# EAGLE design Trash_Bin_Board_V1.0 (EAGLE 7.7.0)
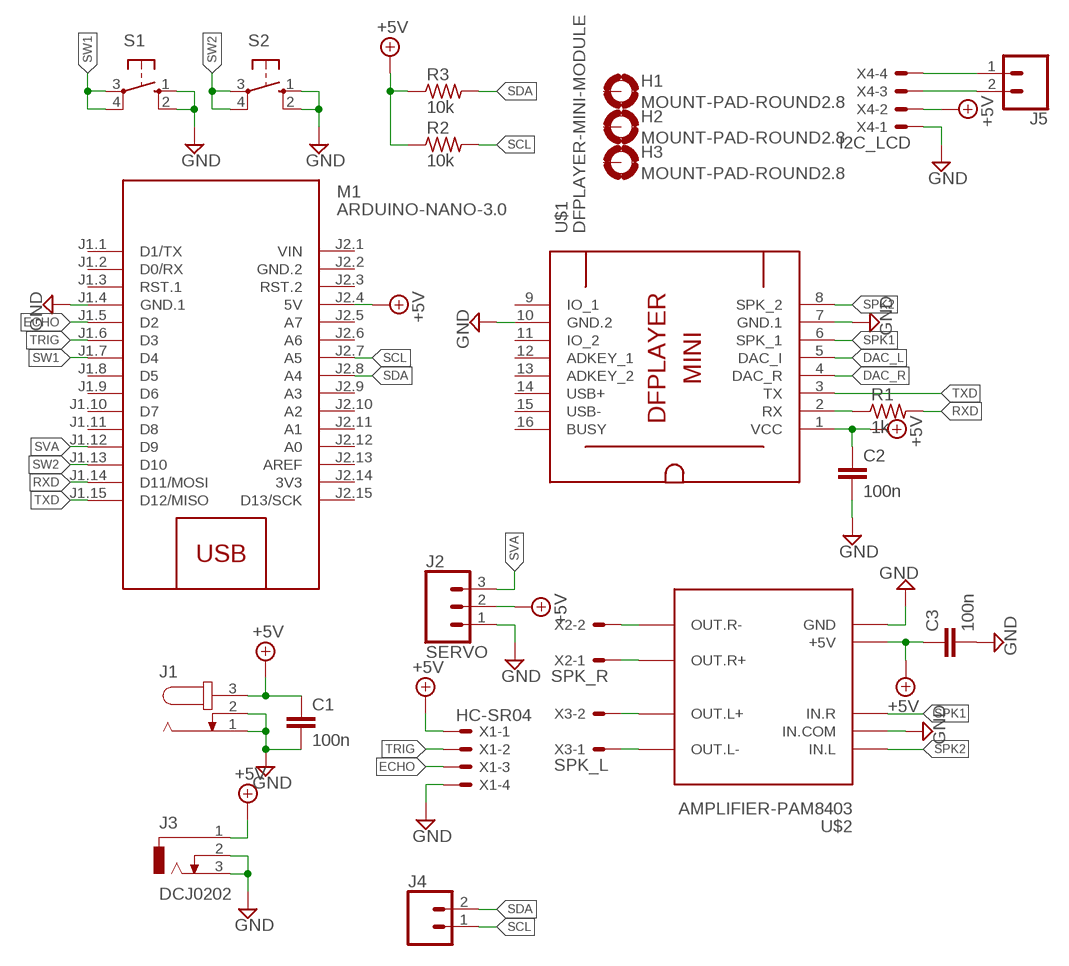
[diagram p0: schematic, sheet 1]

## Parts
C1  100n  C2,5-3  [C2.5-3]
C2  100n  C2,5-3  [C2.5-3]
C3  100n  C2,5-3  [C2.5-3]
H1  MOUNT-PAD-ROUND2.8  [2,8-PAD]
H2  MOUNT-PAD-ROUND2.8  [2,8-PAD]
H3  MOUNT-PAD-ROUND2.8  [2,8-PAD]
J1  JACK-PLUG0  [SPC4077]
J2  SERVO  CONN_03  [1X03]
J3  DCJ0202  [DCJ0202]
J4  CONN_02  [1X02]
J5  CONN_02  [1X02]
M1  ARDUINO-NANO-3.0  [ARDUINO-NANO-3.0]
R1  1k  R-US_0207/7  [0207/7]
R2  10k  R-US_0207/7  [0207/7]
R3  10k  R-US_0207/7  [0207/7]
S1  10-XX  [B3F-10XX]
S2  10-XX  [B3F-10XX]
U$1  DFPLAYER-MINI-MODULE  [DFPLAYER-MINI-MODULE]
U$2  AMPLIFIER-PAM8403  [AMPLIFIER-PAM8403]
X1  HC-SR04  JST-XH-04-PIN-LONG-PAD  [JST-XH-04-PACKAGE-LONG-PAD]
X2  SPK_R  JST-XH-02-PIN-LONG-PAD  [JST-XH-02-PACKAGE-LONG-PAD]
X3  SPK_L  JST-XH-02-PIN-LONG-PAD  [JST-XH-02-PACKAGE-LONG-PAD]
X4  I2C_LCD  JST-XH-04-PIN-LONG-PAD  [JST-XH-04-PACKAGE-LONG-PAD]

## Nets
+5V: C1.1 C2.1 C3.1 J1.3 J2.2 J3.1 M1.J2.4(5V) R2.1 R3.1 U$1.1(VCC) U$2.+5V X1.1 X4.2
DAC_L: U$1.5(DAC_I)
DAC_R: U$1.4(DAC_R)
ECHO: M1.J1.5(D2) X1.3
GND: C1.2 C2.2 C3.2 J1.1 J1.2 J2.1 J3.2 J3.3 M1.J1.4(GND.1) S1.1(S) S1.2(S1) S2.1(S) S2.2(S1) U$1.7(GND.1) U$1.10(GND.2) U$2.GND U$2.IN.COM X1.4 X4.1
N$1: R1.1 U$1.2(RX)
N$2: U$2.OUT.R- X2.2
N$3: U$2.OUT.R+ X2.1
N$4: U$2.OUT.L+ X3.2
N$5: U$2.OUT.L- X3.1
N$7: J5.1 X4.4
N$8: J5.2 X4.3
RXD: M1.J1.14(D11/MOSI) R1.2
SCL: J4.1 M1.J2.7(A5) R2.2
SDA: J4.2 M1.J2.8(A4) R3.2
SPK1: U$1.6(SPK_1) U$2.IN.R
SPK2: U$1.8(SPK_2) U$2.IN.L
SVA: J2.3 M1.J1.12(D9)
SW1: M1.J1.7(D4) S1.3(P) S1.4(P1)
SW2: M1.J1.13(D10) S2.3(P) S2.4(P1)
TRIG: M1.J1.6(D3) X1.2
TXD: M1.J1.15(D12/MISO) U$1.3(TX)
Unconnected: H1.B2,8(MOUNT) H2.B2,8(MOUNT) H3.B2,8(MOUNT) M1.J1.1(D1/TX) M1.J1.2(D0/RX) M1.J1.3(RST.1) M1.J1.8(D5) M1.J1.9(D6) M1.J1.10(D7) M1.J1.11(D8) M1.J2.3(RST.2) M1.J2.5(A7) M1.J2.6(A6) M1.J2.9(A3) M1.J2.10(A2) M1.J2.11(A1) M1.J2.12(A0) M1.J2.13(AREF) M1.J2.15(D13/SCK) U$1.9(IO_1) U$1.11(IO_2) U$1.12(ADKEY_1) U$1.13(ADKEY_2) U$1.14(USB+) U$1.15(USB-) U$1.16(BUSY)

## Power pins joined to a net without a drawn wire
3V3: M1.J2.14(3V3)
GND.2: M1.J2.2(GND.2)
VIN: M1.J2.1(VIN)

## Library data of the parts
C1-C3 = capacitor-wima(Aion):C: CAPACITOR naming: grid - package width
H1-H3 = holes:MOUNT-PAD-ROUND: MOUNTING PAD, round
J1 = con-jack:JACK-PLUG: DC POWER JACK Power Jack, DC, Right Angle, Through Hole, Rated 5A at 16VDC, PC Terminals Distributor: Farnell (www.Farnell.de) Drawing: 84N1161.pdf / 84N1162.pdf Manufacturer: SPC Technology (www.spctechnology.com) Type: SPC4077 / SPC 4078; OC_FARNELL: unknown; OC_NEWARK: unknown
J2 = SparkFun-Connectors:CONN_03: Multi connection point. Often used as Generic Header-pin footprint for 0.1 inch spaced/style header connections On any of the 0.1 inch spaced packages, you can populate with these: Break Away Headers - Straight <https://www.sparkfun.com/products/116> (PRT-00116) Break Away Male Headers - Right Angle <https://www.sparkfun.com/products/553> (PRT-00553) Female Headers <https://www.sparkfun.com/products/115> (PRT-00115) Break Away Headers - Machine Pin <https://www.sparkfun.com/products/117> (PRT-00117) Break Away Female Headers - Swiss Machine Pin <https://www.sparkfun.com/products/743> (PRT-00743) Stackable Header - 3 Pin (Female, 0.1") <https://www.sparkfun.com/products/13875> (PRT-13875) For SCREWTERMINALS and SPRING TERMINALS visit here: Screw Terimnals on SparkFun.com <https://www.sparkfun.com/search/results?term=Screw+Terminals> (5mm/3.5mm/2.54mm spacing) This device is also useful as a general connection point to wire up your design to another part of your project. Our various solder wires solder well into these plated through hole pads. Hook-Up Wire - Assortment (Stranded, 22 AWG) <https://www.sparkfun.com/products/11375> (PRT-11375) Hook-Up Wire - Assortment (Solid Core, 22 AWG) <https://www.sparkfun.com/products/11367> (PRT-11367) View the entire wire category on our website here <https://www.sparkfun.com/categories/141> Special notes: Molex polarized connector foot print use with SKU : PRT-08232 with associated crimp pins and housings.; PROD_ID: XXX-00000; VALUE: 455-1750-1-ND
J3 = con-jack:DCJ0202: DC POWER JACK Source: DCJ0202.pdf; OC_FARNELL: unknown; OC_NEWARK: unknown
J4 J5 = SparkFun-Connectors:CONN_02: Multi connection point. Often used as Generic Header-pin footprint for 0.1 inch spaced/style header connections On any of the 0.1 inch spaced packages, you can populate with these: Break Away Headers - Straight <https://www.sparkfun.com/products/116> (PRT-00116) Break Away Male Headers - Right Angle <https://www.sparkfun.com/products/553> (PRT-00553) Female Headers <https://www.sparkfun.com/products/115> (PRT-00115) Break Away Headers - Machine Pin <https://www.sparkfun.com/products/117> (PRT-00117) Break Away Female Headers - Swiss Machine Pin <https://www.sparkfun.com/products/743> (PRT-00743) For SCREWTERMINALS and SPRING TERMINALS visit here: Screw Terimnals on SparkFun.com <https://www.sparkfun.com/search/results?term=Screw+Terminals> (5mm/3.5mm/2.54mm spacing) This device is also useful as a general connection point to wire up your design to another part of your project. Our various solder wires solder well into these plated through hole pads. Hook-Up Wire - Assortment (Stranded, 22 AWG) <https://www.sparkfun.com/products/11375> (PRT-11375) Hook-Up Wire - Assortment (Solid Core, 22 AWG) <https://www.sparkfun.com/products/11367> (PRT-11367) View the entire wire category on our website here <https://www.sparkfun.com/categories/141> Special notes: Molex polarized connector foot print use with: PRT-08233 with associated crimp pins and housings. 2.54_SCREWTERM for use with PRT-10571. 3.5mm Screw Terminal footprints for PRT-08084 5mm Screw Terminal footprints for use with PRT-08432
M1 = diy-modules_lcd:ARDUINO-NANO-3.0: Arduino Nano 3.0 and compatible devices More details available here: https://www.arduino.cc/en/Main/ArduinoBoardNano Click here to find device on ebay.com <http://www.ebay.com/sch/arduino+nano>
R1-R3 = resistor(Aion):R-US_: RESISTOR, American symbol
S1 S2 = switch-omron:10-XX: OMRON SWITCH; MPN: B3F-1000; OC_FARNELL: 176432; OC_NEWARK: 36M3542
U$1 = diy-modules_lcd:DFPLAYER-MINI-MODULE: DFPlayer Mini - MP3 player module based on YX5200 chip More details available here: https://www.dfrobot.com/wiki/index.php/DFPlayer_Mini_SKU:DFR0299 Click here to find device on ebay.com <http://www.ebay.com/sch/dfplayer+mini>
U$2 = diy-modules_lcd:AMPLIFIER-PAM8403: Stereo Class-D 3W Audio Amplifier based on PAM8403 chip More details available here: http://artofcircuits.com/product/pam8403-5v-two-channel-stereo-mini-class-d-3w3w-audio-amplifier Click here to find device on ebay.com <http://www.ebay.com/sch/pam8403+mini+class+d>
X1 X4 = JST XH Connectors v1-0:JST-XH-04-PIN: JST XH Connector 2 Pin Wire to board connector. Pitch: 2,54 mm, (0.100") Number of pins: 4 Created by Rembrandt Electronics www.rembrandtelectronics.com
X2 X3 = JST XH Connectors v1-0:JST-XH-02-PIN: JST XH Connector 2 Pin Wire to board connector. Pitch: 2,54 mm, (0.100") Number of pins: 2 Created by Rembrandt Electronics www.rembrandtelectronics.com

## Board
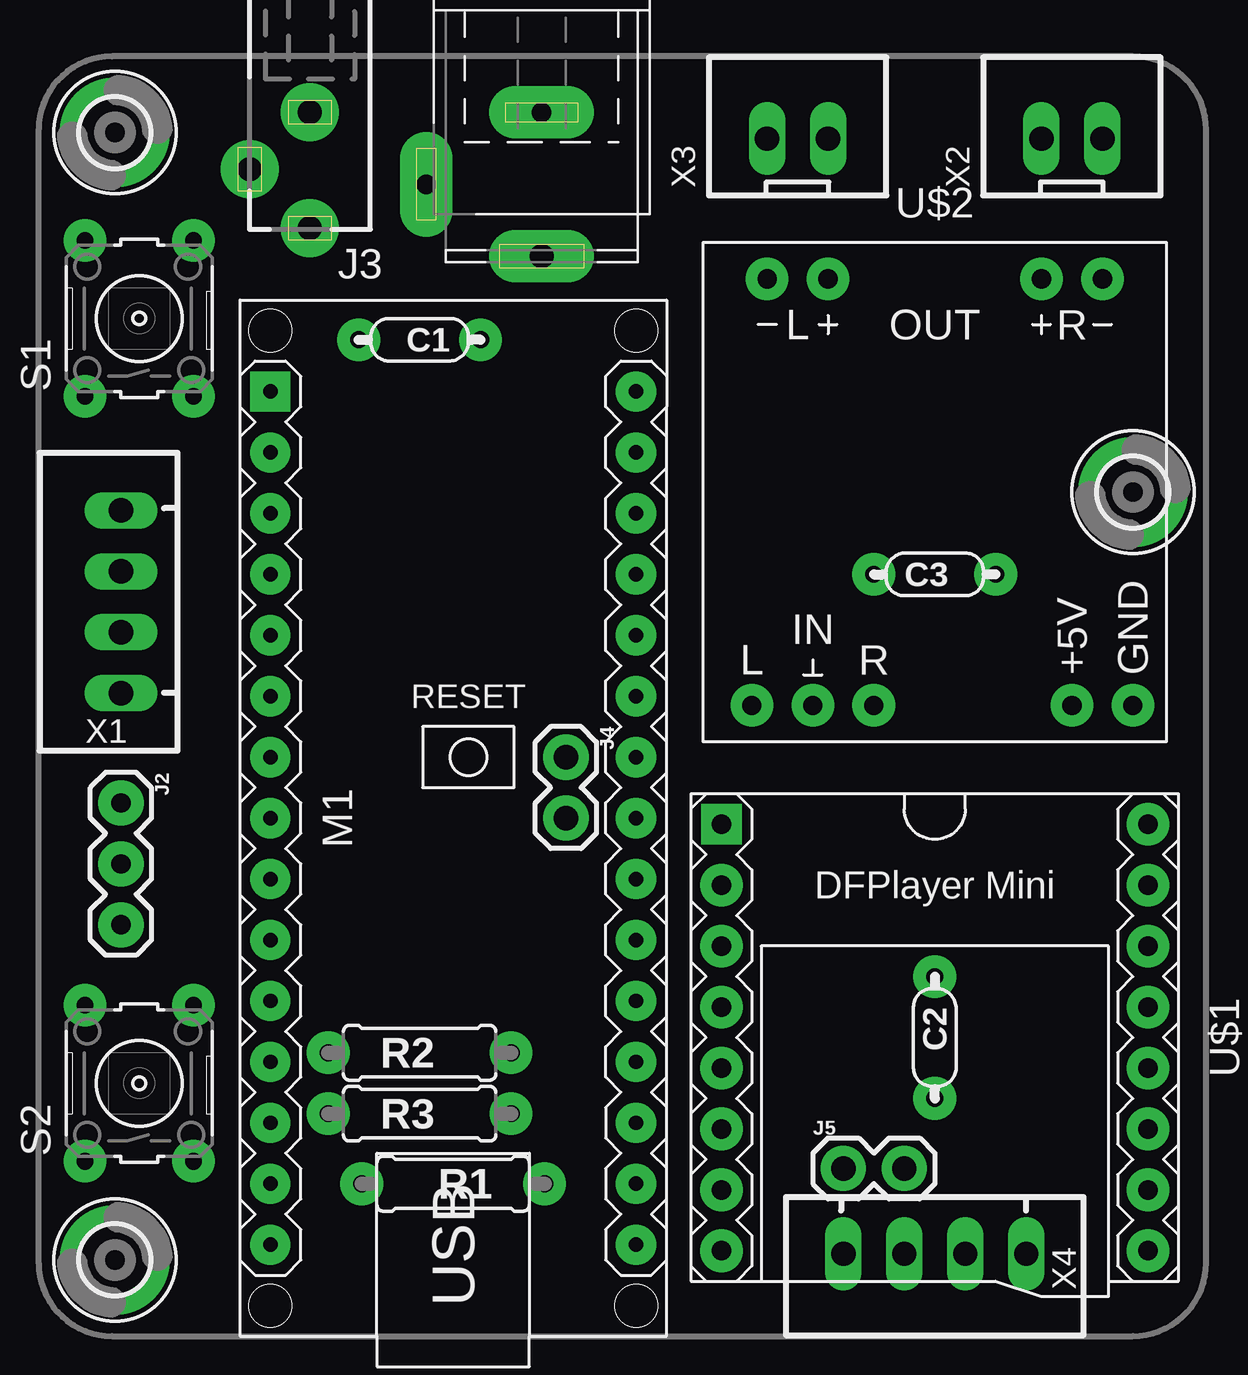
[diagram p1: board, top side]
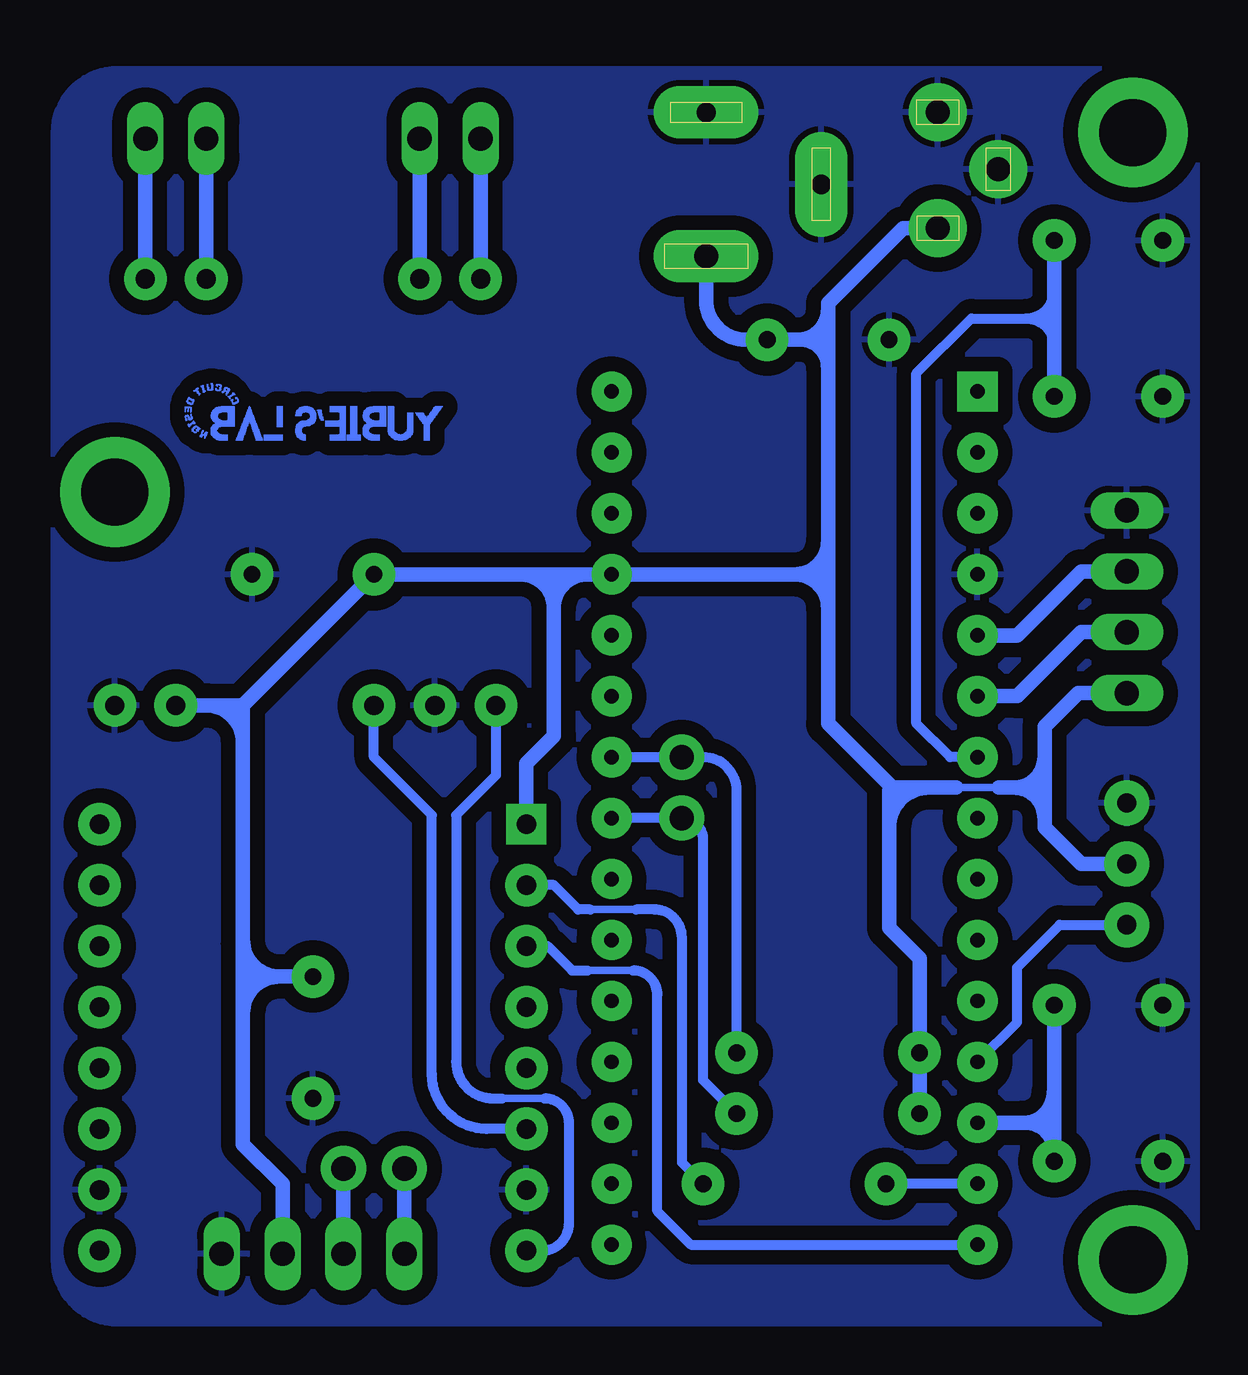
[diagram p2: board, bottom side, seen from below]

No outline drawn. Coordinates in mm, seen from the top.
Copper layers (1*16): Top 0.035mm / dielectric 1.5mm / Bottom 0.035mm
Design rules "default": minimum track width 10mil, minimum drill 24mil, track to track 8mil, track to pad 8mil, pad to pad 8mil, via to via 8mil, smd to smd 8mil, copper to edge 40mil, drill to drill 8mil, minimum pad ring 10mil, minimum via ring 8mil, stop-mask expansion 4mil, vias tented up to drill 0mil, thermal gap 10mil

### Footprints (pad centres in the part's own frame; a part is rotated, then mirrored left to right if it is on the bottom)
C2.5-3 = drill 0.7 pad 1.778: 1 -2.54,0; 2 2.54,0
2,8-PAD = drill 2.8 pad 4.572: B2,8 0,0
SPC4077 = drill 0.8 pad 2.184 long: 1 -3,0; 2 0,-4.8 | drill 1 pad 2.184 long: 3 3,0
1X03 = drill 0.8 pad 1.88: 1 0,0; 2 2.54,0; 3 5.08,0
DCJ0202 = drill 1 pad 2.413: 1 0,3.862; 2 2.514,1.397; 3 0,-0.968
1X02 = drill 1.016 pad 1.88: 1 0,0; 2 2.54,0
ARDUINO-NANO-3.0 = drill 0.6 pad 1.676 square: J1.1 17.78,7.62 | drill 0.6 pad 1.676: J1.2 15.24,7.62; J1.3 12.7,7.62; J1.4 10.16,7.62; J1.5 7.62,7.62; J1.6 5.08,7.62; J1.7 2.54,7.62; J1.8 0,7.62; J1.9 -2.54,7.62; J1.10 -5.08,7.62; J1.11 -7.62,7.62; J1.12 -10.16,7.62; J1.13 -12.7,7.62; J1.14 -15.24,7.62; J1.15 -17.78,7.62; J2.1 17.78,-7.62; J2.2 15.24,-7.62; J2.3 12.7,-7.62; J2.4 10.16,-7.62; J2.5 7.62,-7.62; J2.6 5.08,-7.62; J2.7 2.54,-7.62; J2.8 0,-7.62; J2.9 -2.54,-7.62; J2.10 -5.08,-7.62; J2.11 -7.62,-7.62; J2.12 -10.16,-7.62; J2.13 -12.7,-7.62; J2.14 -15.24,-7.62; J2.15 -17.78,-7.62
0207/7 = drill 0.7 pad 1.778: 1 -3.81,0; 2 3.81,0
B3F-10XX = drill 0.7 pad 1.778: 1 -3.251,2.261; 2 3.251,2.261; 3 -3.251,-2.261; 4 3.251,-2.261
DFPLAYER-MINI-MODULE = drill 0.813 pad 1.676 square: 1 -8.89,-8.89 | drill 0.813 pad 1.778: 2 -6.35,-8.89; 3 -3.81,-8.89; 4 -1.27,-8.89; 5 1.27,-8.89; 6 3.81,-8.89; 7 6.35,-8.89; 8 8.89,-8.89; 9 8.89,8.89; 10 6.35,8.89; 11 3.81,8.89; 12 1.27,8.89; 13 -1.27,8.89; 14 -3.81,8.89; 15 -6.35,8.89; 16 -8.89,8.89
AMPLIFIER-PAM8403 = drill 0.8 pad 1.778: +5V 5.715,-8.89; GND 8.255,-8.89; IN.COM -5.08,-8.89; IN.L -7.62,-8.89; IN.R -2.54,-8.89; OUT.L+ -4.445,8.89; OUT.L- -6.985,8.89; OUT.R+ 4.445,8.89; OUT.R- 6.985,8.89
JST-XH-04-PACKAGE-LONG-PAD = drill 1.016 long: 1 -3.81,0; 2 -1.27,0; 3 1.27,0; 4 3.81,0
JST-XH-02-PACKAGE-LONG-PAD = drill 1.016 long: 1 -1.27,0; 2 1.27,0

### Placement (x,y rotation side)
C1  15.88,41.53 180 top
C2  37.34,12.45 270 top
C3  37.34,31.75 0 top
H1  3.17,3.17 0 top
H2  45.59,35.18 0 top
H3  3.17,50.16 0 top
J1  20.95,48.01 270 top
J2  3.43,22.23 270 top
J3  11.3,50.04 180 top
J4  21.97,24.13 270 top
J5  33.53,6.99 0 top
M1  17.27,21.59 90 top
R1  17.27,6.35 180 top
R2  15.88,11.81 0 top
R3  15.88,9.27 0 top
S1  4.19,42.42 90 top
S2  4.19,10.54 90 top
U$1  37.34,12.45 270 top
U$2  37.34,35.18 0 top
X1  3.43,30.61 90 top
X2  43.05,49.91 0 top
X3  31.62,49.91 0 top
X4  37.34,3.43 180 top

### Tracks (layer width: path | path; a pad name or v marks a point on that pad's centre or on a via)
+5V
  Bottom 0.305: 10.54,22.86 8.76,22.86
  Bottom 0.61: J2.2 5.33,19.68 6.86,21.21 6.86,21.59 | 6.86,21.59 6.86,22.86 | 6.86,22.86 6.86,24.13 | 6.86,24.13 6.86,25.4 5.46,26.8 X1.1 | 15.88,31.75 17.27,31.75 | 17.27,31.75 M1.J2.4 25.91,31.75 | 25.91,31.75 27.3,31.75 | 27.3,31.75 28.7,31.75 | 28.7,31.75 C3.1 40.26,26.29 40.26,26.16 | U$1.1 28.45,23.88 27.3,25.02 27.3,30.35 | 27.3,30.35 27.3,31.75 | 40.26,26.16 40.26,24.77 | U$2.+5V 41.78,26.29 | 41.78,26.29 40.39,26.29 40.26,26.16 | 17.14,41.53 17.02,41.53 | 17.02,41.53 15.88,41.53 | 15.88,41.53 15.88,40.39 | 15.88,40.39 15.88,33.15 | 15.88,33.15 15.88,31.75 | 15.88,31.75 15.88,30.35 | 15.88,30.35 15.88,25.53 13.21,22.86 | 13.21,22.86 11.68,22.86 | 11.68,22.86 10.54,22.86 | 8.13,22.86 6.86,22.86 | 41.78,26.29 arc90 40.26,24.77 | 25.91,31.75 arc-90 27.3,30.35 | 27.3,30.35 arc-90 28.7,31.75 | 17.27,31.75 arc-90 15.88,33.15 | 17.27,31.75 arc90 15.88,30.35 | 8.76,22.86 8.13,22.86 | 8.13,22.86 arc-90 6.86,24.13 | 8.13,22.86 arc90 6.86,21.59 | 17.02,41.53 arc90 15.88,40.39 | R3.1 R2.1 12.06,15.75 13.34,17.02 13.34,21.21 | 13.34,21.21 13.34,22.73 13.21,22.86 | 40.26,24.77 40.26,16.51 | 40.26,16.51 40.26,14.99 | 40.26,14.99 40.26,13.46 | 40.26,13.46 40.26,8 38.61,6.35 X4.2 | C2.1 38.73,14.99 | 38.73,14.99 40.26,14.99 | 38.73,14.99 arc90 40.26,16.51 | 38.73,14.99 arc-90 40.26,13.46 | J1.3 20.95,43.18 arc-90 19.3,41.53 C1.1 18.03,41.53 17.14,41.53 | J3.1 12.75,46.18 15.88,43.05 15.88,42.8 | 15.88,42.8 15.88,41.53 | 11.68,22.86 arc-90 13.34,21.21 | 17.14,41.53 arc-90 15.88,42.8
ECHO
  Bottom 0.61: X1.3 5.33,31.88 8,29.21 M1.J1.5
GND
  pour Bottom (isolate 0.61): 3.17,0.51 45.47,0.51 arc90 48.13,3.17 48.13,50.16 arc90 45.47,52.83 3.05,52.83 arc90 0.51,50.29 0.51,3.17 arc90
N$1
  Bottom 0.305: 23.88,17.78 25.78,17.78
  Bottom 0.406: 25.78,17.78 26.29,17.78 27.3,18.8 U$1.2 | R1.1 21.97,7.24 21.97,16.64 arc-90 23.11,17.78 23.88,17.78
N$2
  Bottom 0.61: U$2.OUT.R- X2.2
N$3
  Bottom 0.61: U$2.OUT.R+ X2.1
N$4
  Bottom 0.61: U$2.OUT.L+ X3.2
N$5
  Bottom 0.61: U$2.OUT.L- X3.1
N$6
  pour Bottom (isolate 0.61): 3.3,0.51 45.47,0.51 arc90 48.13,3.17 48.13,50.16 arc90 45.47,52.83 3.17,52.83 arc90 0.51,50.16 0.51,3.3 arc90
N$7
  Bottom 0.61: J5.1 X4.4
N$8
  Bottom 0.61: J5.2 X4.3
RXD
  Bottom 0.406: M1.J1.14 R1.2
SCL
  Bottom 0.406: R2.2 19.68,22.73 arc-90 21.08,24.13 J4.1 M1.J2.7
SDA
  Bottom 0.406: R3.2 21.08,10.67 21.08,20.7 arc-90 J4.2 M1.J2.8
SPK1
  Bottom 0.406: U$2.IN.R 34.8,24.13 32.38,21.72 32.38,10.92 arc-90 30.1,8.64 U$1.6
SPK2
  Bottom 0.305: 29.46,9.91 27.69,9.91
  Bottom 0.406: U$2.IN.L 29.72,23.37 31.37,21.72 31.37,11.43 arc-90 29.84,9.91 29.46,9.91 | U$1.8 27.81,3.56 arc-90 26.67,4.7 26.67,8.89 arc-90 27.69,9.91
SVA
  Bottom 0.406: M1.J1.12 8,13.08 8,15.37 6.22,17.14 J2.3
SW1
  Bottom 0.406: M1.J1.7 10.79,24.13 12.19,25.53 12.19,40.13 9.91,42.42 7.62,42.42 | 7.62,42.42 6.45,42.42 | 7.62,42.42 arc-90 6.48,43.56 | 7.62,42.42 arc90 6.48,41.27
  Bottom 0.61: S1.4 6.45,42.42 S1.3
SW2
  Bottom 0.61: S2.4 6.45,8.76 | 6.45,8.76 S2.3 | M1.J1.13 7.75,8.89 | 7.62,8.89 6.58,8.89 6.45,8.76 | 7.75,8.89 7.62,8.89 | 7.62,8.89 arc90 6.48,7.75 | 7.75,8.89 arc-90 6.48,10.16
TRIG
  Bottom 0.61: X1.2 5.33,29.34 8,26.67 M1.J1.6
TXD
  Bottom 0.305: 25.91,15.24 24,15.24
  Bottom 0.406: U$1.3 27.56,16.26 26.54,15.24 25.91,15.24 | M1.J1.15 21.59,3.81 22.99,5.21 22.99,14.22 arc-90 24,15.24
(copper drawn outside any net)
  shapes: Bottom area x864

### Text on the board
tDocu: DC_IN | SPK_L | SPK_R | C1 | G | C3 | HC_SR04 | G | +5V | SERVO | R1